# Altium schematic sheet Servo4.SchDoc
size 420 x 297 mm; SheetNumber: 22; SheetTotal: 26
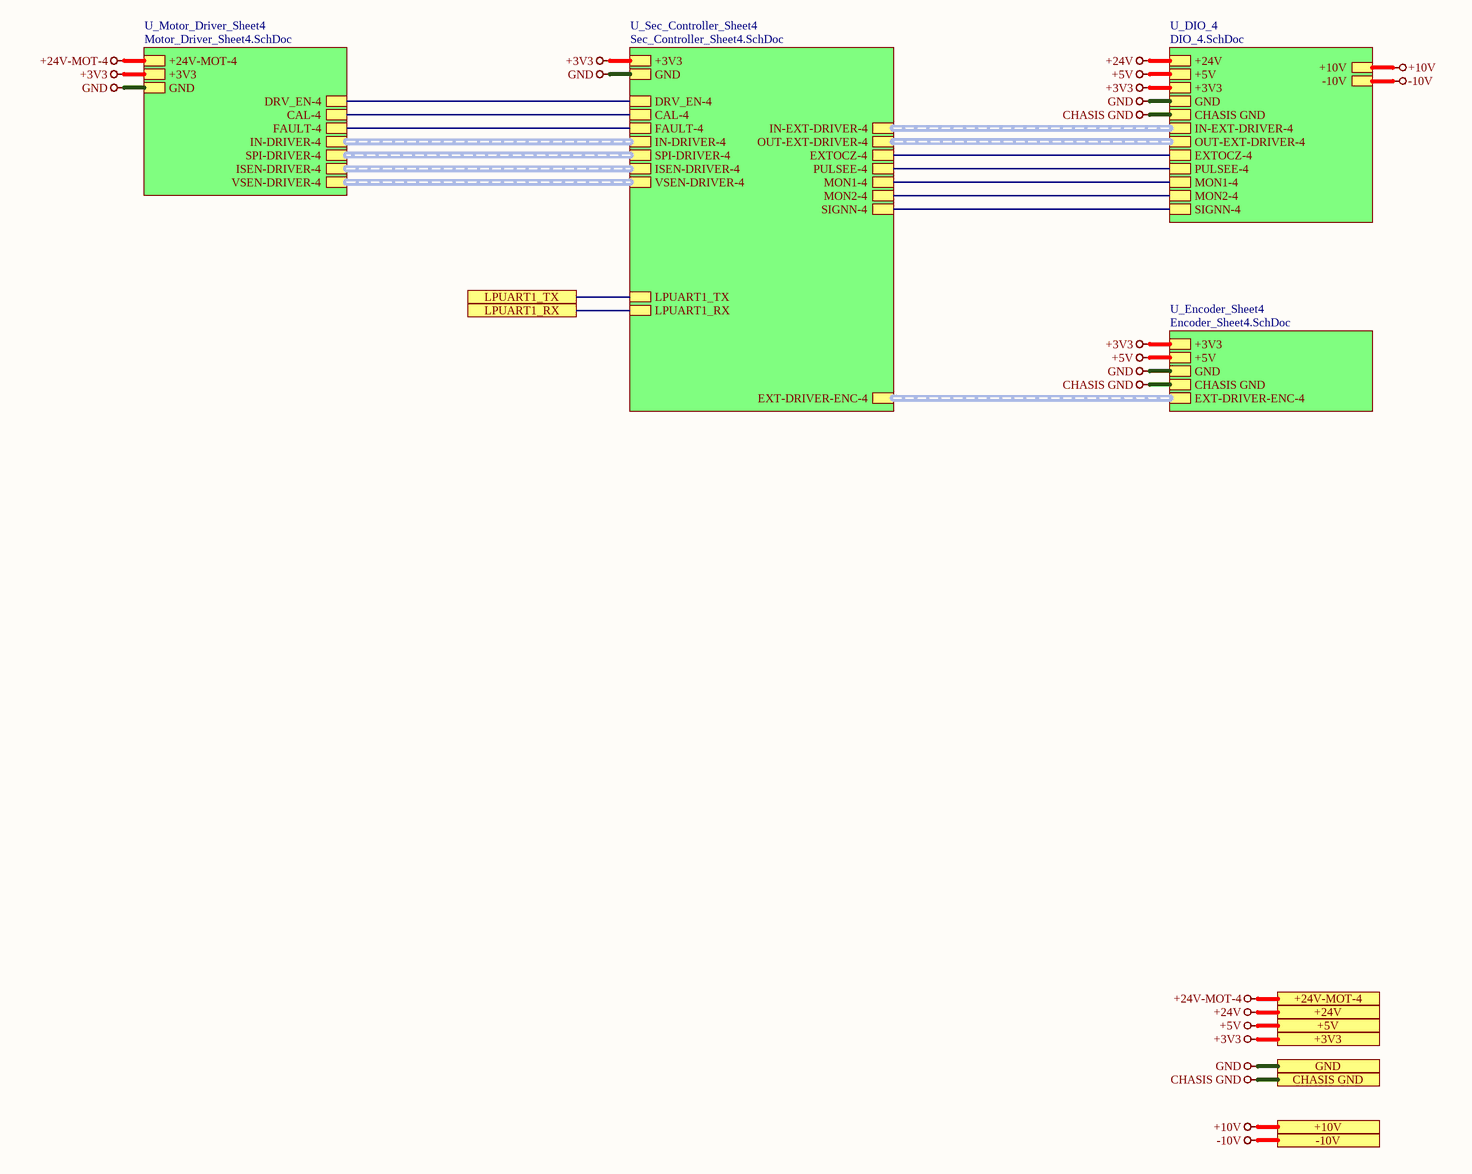
[diagram p0: Servo4.SchDoc]

## Sub-sheets
U_DIO_4 = DIO_4.SchDoc: +24V, +5V, GND, +3V3, CHASIS GND, IN-EXT-DRIVER-4 (harness IN-EXT-DRIVER-4), OUT-EXT-DRIVER-4 (harness OUT-EXT-DRIVER-4), EXTOCZ-4, PULSEE-4, MON1-4, MON2-4, SIGNN-4, +10V, -10V
U_Encoder_Sheet4 = Encoder_Sheet4.SchDoc: +3V3, +5V, GND, CHASIS GND, EXT-DRIVER-ENC-4 (harness EXT-DRIVER-ENC-4)
U_Motor_Driver_Sheet4 = Motor_Driver_Sheet4.SchDoc: +24V-MOT-4, +3V3, GND, DRV_EN-4, CAL-4, FAULT-4, IN-DRIVER-4 (harness IN-DRIVER-4), SPI-DRIVER-4 (harness SPI-DRIVER-4), ISEN-DRIVER-4 (harness ISEN-DRIVER-4), VSEN-DRIVER-4 (harness VSEN-DRIVER-4)
U_Sec_Controller_Sheet4 = Sec_Controller_Sheet4.SchDoc: +3V3, GND, IN-DRIVER-4 (harness IN-DRIVER-4), DRV_EN-4, CAL-4, FAULT-4, SPI-DRIVER-4 (harness SPI-DRIVER-4), ISEN-DRIVER-4 (harness ISEN-DRIVER-4), EXT-DRIVER-ENC-4 (harness EXT-DRIVER-ENC-4), IN-EXT-DRIVER-4 (harness IN-EXT-DRIVER-4), OUT-EXT-DRIVER-4 (harness OUT-EXT-DRIVER-4), EXTOCZ-4, PULSEE-4, MON1-4, MON2-4, SIGNN-4, LPUART1_TX, LPUART1_RX, VSEN-DRIVER-4 (harness VSEN-DRIVER-4)

## Ports
+3V3 (see Top_Sheet[5C], CAN_Sheet[4D], Controller_Sheet[5D], DIO_1[5D], DIO_2[5D], DIO_3[5D], DIO_4[5D], Encoder_Sheet1[5D], Encoder_Sheet2[4D], Encoder_Sheet3[4D], Encoder_Sheet4[5D], EtherCAT_Sheet[5D], Motor_Driver_Sheet1[5D], Motor_Driver_Sheet2[5D], Motor_Driver_Sheet3[5D], Motor_Driver_Sheet4[5D], Power_Sheet[5D], RS485_RS232_Sheet[5D], Sec_Controller_Sheet1[5D], Sec_Controller_Sheet2[5D], Sec_Controller_Sheet3[5D], Sec_Controller_Sheet4[5D], Servo1[5D], Servo2[5D], Servo3[5D]), +5V (see Top_Sheet[5C], CAN_Sheet[4D], Controller_Sheet[5D], DIO_1[5D], DIO_2[5D], DIO_3[5D], DIO_4[5D], Encoder_Sheet1[5D], Encoder_Sheet2[4D], Encoder_Sheet3[4D], Encoder_Sheet4[5D], Power_Sheet[5D], Servo1[5D], Servo2[5D], Servo3[5D]), +10V (see Top_Sheet[5C], DIO_1[5D], DIO_2[5D], DIO_3[5D], DIO_4[5D], Power_Sheet[5D], Servo1[5D], Servo2[5D], Servo3[5D]), +24V (see Top_Sheet[5C], DIO_1[5D], DIO_2[5D], DIO_3[5D], DIO_4[5D], Power_Sheet[5D], Servo1[5D], Servo2[5D], Servo3[5D]), +24V-MOT-4 (see Top_Sheet[5C], Motor_Driver_Sheet4[5D], Power_Sheet[5D]), -10V (see Top_Sheet[5C], DIO_1[5D], DIO_2[5D], DIO_3[5D], DIO_4[5D], Power_Sheet[5D], Servo1[5D], Servo2[5D], Servo3[5D]), CHASIS GND (see Top_Sheet[5C], DIO_1[5D], DIO_2[5D], DIO_3[5D], DIO_4[5D], Encoder_Sheet1[5D], Encoder_Sheet2[4D], Encoder_Sheet3[4D], Encoder_Sheet4[5D], EtherCAT_Sheet[5D], Power_Sheet[5D], Servo1[5D], Servo2[5D], Servo3[5D]), GND (see Top_Sheet[5C], CAN_Sheet[4D], Controller_Sheet[5D], DIO_1[5D], DIO_2[5D], DIO_3[5D], DIO_4[5D], Encoder_Sheet1[5D], Encoder_Sheet2[4D], Encoder_Sheet3[4D], Encoder_Sheet4[5D], EtherCAT_Sheet[5D], Motor_Driver_Sheet1[5D], Motor_Driver_Sheet2[5D], Motor_Driver_Sheet3[5D], Motor_Driver_Sheet4[5D], Power_Sheet[5D], RS485_RS232_Sheet[5D], Sec_Controller_Sheet1[5D], Sec_Controller_Sheet2[5D], Sec_Controller_Sheet3[5D], Sec_Controller_Sheet4[5D], Servo1[5D], Servo2[5D], Servo3[5D]), LPUART1_RX (see Top_Sheet[5C], Controller_Sheet[4D], Sec_Controller_Sheet4[5D]), LPUART1_TX (see Top_Sheet[5C], Controller_Sheet[4D], Sec_Controller_Sheet4[5D])

## Nets
+3V3: port +3V3, sheet U_Sec_Controller_Sheet4/+3V3, sheet U_Motor_Driver_Sheet4/+3V3, sheet U_Encoder_Sheet4/+3V3, sheet U_DIO_4/+3V3
+5V: port +5V, sheet U_Encoder_Sheet4/+5V, sheet U_DIO_4/+5V
+10V: port +10V, sheet U_DIO_4/+10V
+24V: port +24V, sheet U_DIO_4/+24V
+24V-MOT-4: port +24V-MOT-4, sheet U_Motor_Driver_Sheet4/+24V-MOT-4
-10V: port -10V, sheet U_DIO_4/-10V
CHASIS GND: port CHASIS GND, sheet U_Encoder_Sheet4/CHASIS GND, sheet U_DIO_4/CHASIS GND
GND: port GND, sheet U_Sec_Controller_Sheet4/GND, sheet U_Motor_Driver_Sheet4/GND, sheet U_Encoder_Sheet4/GND, sheet U_DIO_4/GND
LPUART1_RX: port LPUART1_RX, sheet U_Sec_Controller_Sheet4/LPUART1_RX
LPUART1_TX: port LPUART1_TX, sheet U_Sec_Controller_Sheet4/LPUART1_TX
(unnamed): sheet U_Sec_Controller_Sheet4/DRV_EN-4, sheet U_Motor_Driver_Sheet4/DRV_EN-4
(unnamed): sheet U_Sec_Controller_Sheet4/CAL-4, sheet U_Motor_Driver_Sheet4/CAL-4
(unnamed): sheet U_Sec_Controller_Sheet4/FAULT-4, sheet U_Motor_Driver_Sheet4/FAULT-4
(unnamed): sheet U_Sec_Controller_Sheet4/EXTOCZ-4, sheet U_DIO_4/EXTOCZ-4
(unnamed): sheet U_Sec_Controller_Sheet4/PULSEE-4, sheet U_DIO_4/PULSEE-4
(unnamed): sheet U_Sec_Controller_Sheet4/MON1-4, sheet U_DIO_4/MON1-4
(unnamed): sheet U_Sec_Controller_Sheet4/MON2-4, sheet U_DIO_4/MON2-4
(unnamed): sheet U_Sec_Controller_Sheet4/SIGNN-4, sheet U_DIO_4/SIGNN-4

## Buses and harness runs
harness sheet U_DIO_4/IN-EXT-DRIVER-4 = sheet U_Sec_Controller_Sheet4/IN-EXT-DRIVER-4
harness sheet U_DIO_4/OUT-EXT-DRIVER-4 = sheet U_Sec_Controller_Sheet4/OUT-EXT-DRIVER-4
harness sheet U_Encoder_Sheet4/EXT-DRIVER-ENC-4 = sheet U_Sec_Controller_Sheet4/EXT-DRIVER-ENC-4
harness sheet U_Motor_Driver_Sheet4/IN-DRIVER-4 = sheet U_Sec_Controller_Sheet4/IN-DRIVER-4
harness sheet U_Motor_Driver_Sheet4/ISEN-DRIVER-4 = sheet U_Sec_Controller_Sheet4/ISEN-DRIVER-4
harness sheet U_Motor_Driver_Sheet4/SPI-DRIVER-4 = sheet U_Sec_Controller_Sheet4/SPI-DRIVER-4
harness sheet U_Motor_Driver_Sheet4/VSEN-DRIVER-4 = sheet U_Sec_Controller_Sheet4/VSEN-DRIVER-4

## Notes on the sheet
- File:
- Title:
- Date:
- Page
- Num:
- Total:
- Drawn By: Huzaifa Ali